# Altium schematic sheet stm32-electronic-dice_E2_functional-diagram.SchDoc: Игральные кости на базе
size 420 x 297 mm; CheckedBy: Чистяков М.Г.; Author: Советников М.М.; DocumentNumber: ИУ4.11.03.03.25.06.62.18.001 Э2; SheetNumber: 2; SheetTotal: 3; Title2str: микрокроконтроллера STM32F103C8T6; FirstReferrence: ИУ4.11.03.03.25.06.62.18.001; Group: Группа ИУ4-62Б; DocumentType: Схема электрическая функциональная
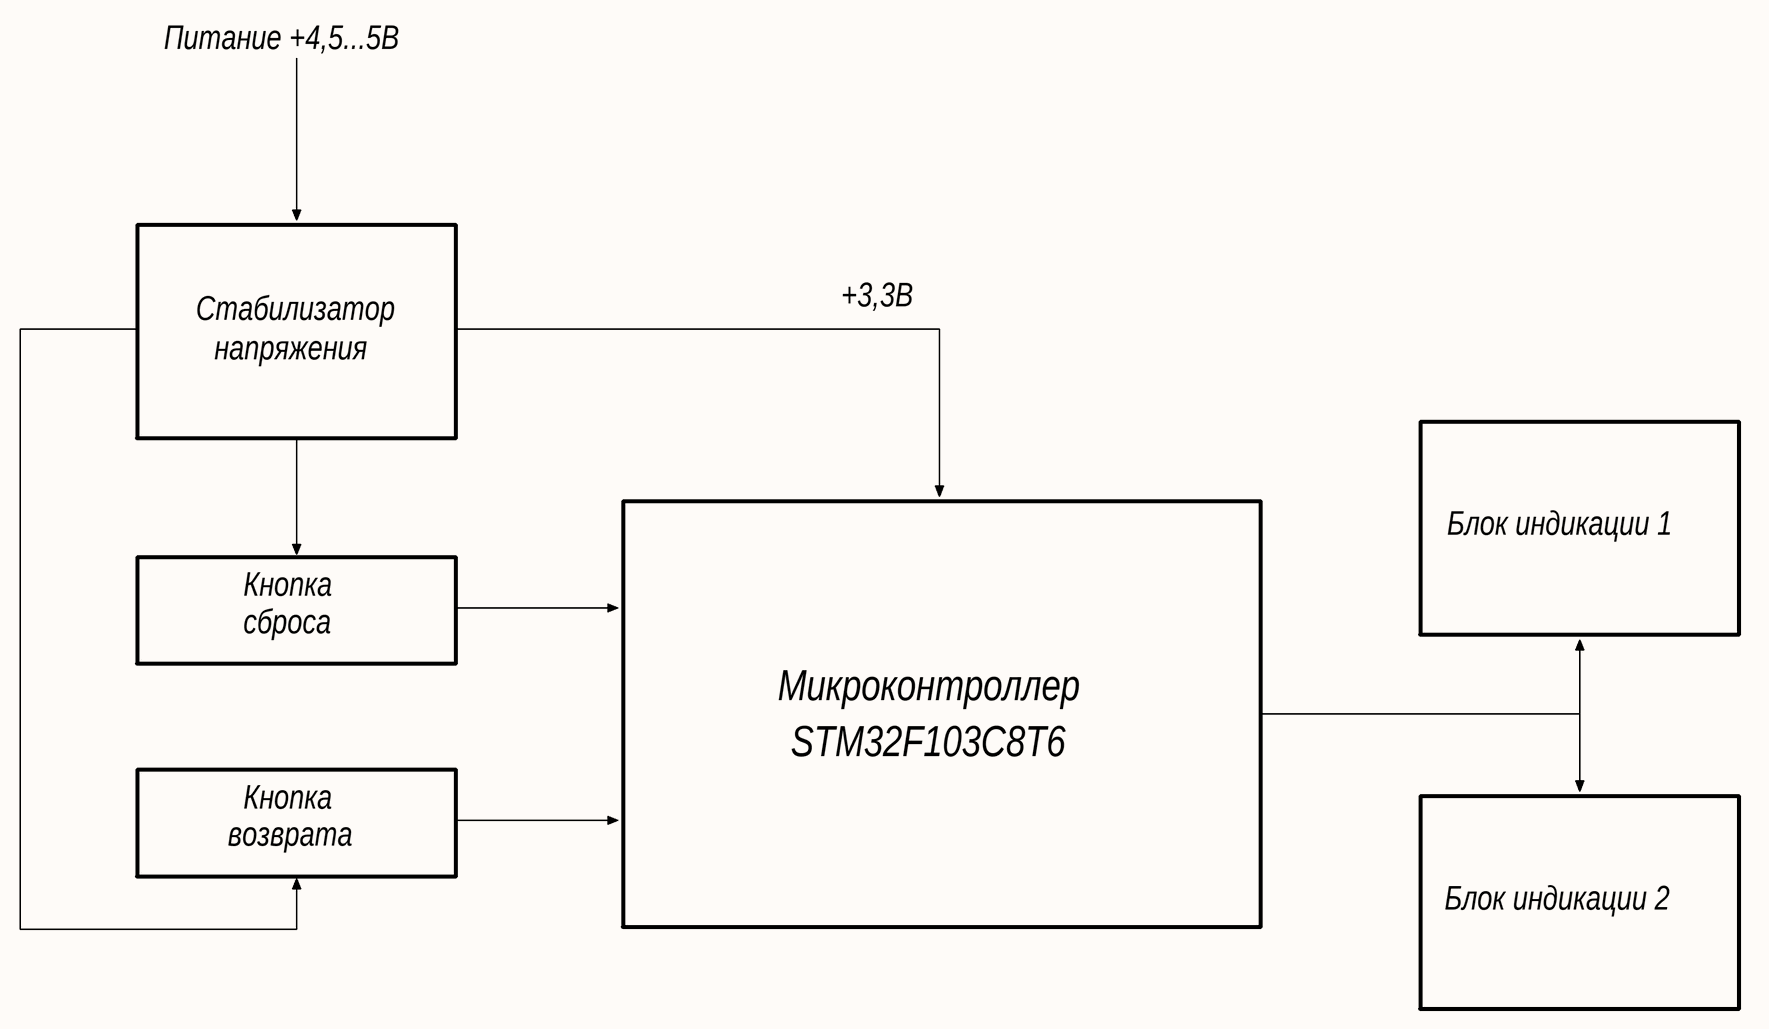
[diagram p0: stm32-electronic-dice_E2_functional-diagram.SchDoc]

## Notes on the sheet
- Питание +4,5...5В
- +3,3В
- Стабилизатор
- напряжения
- Блок индикации 1
- Кнопка
- сброса
- Микроконтроллер
- STM32F103C8T6
- возврата
- Блок индикации 2
- Перв. примен.
- Справ. №
- Подп. и дата
- Инв. № дубл.
- Взам. инв. №
- Разраб.
- Изм.
- Лист
- № докум.
- Подп.
- Дата
- Лит.
- Масса
- Масштаб
- Пров.
- Т.контр.
- Листов
- 1
- Инв. № подл.
- Утв.
- Н.контр.
- Кафедра ИУ4
- МГТУ им. Н.Э. Баумана
- 2.106-A3
- Копировал
- Формат А3